# Altium schematic sheet CH32H417_USB3.SchDoc
size A4; SheetNumber: 11; SheetTotal: 11
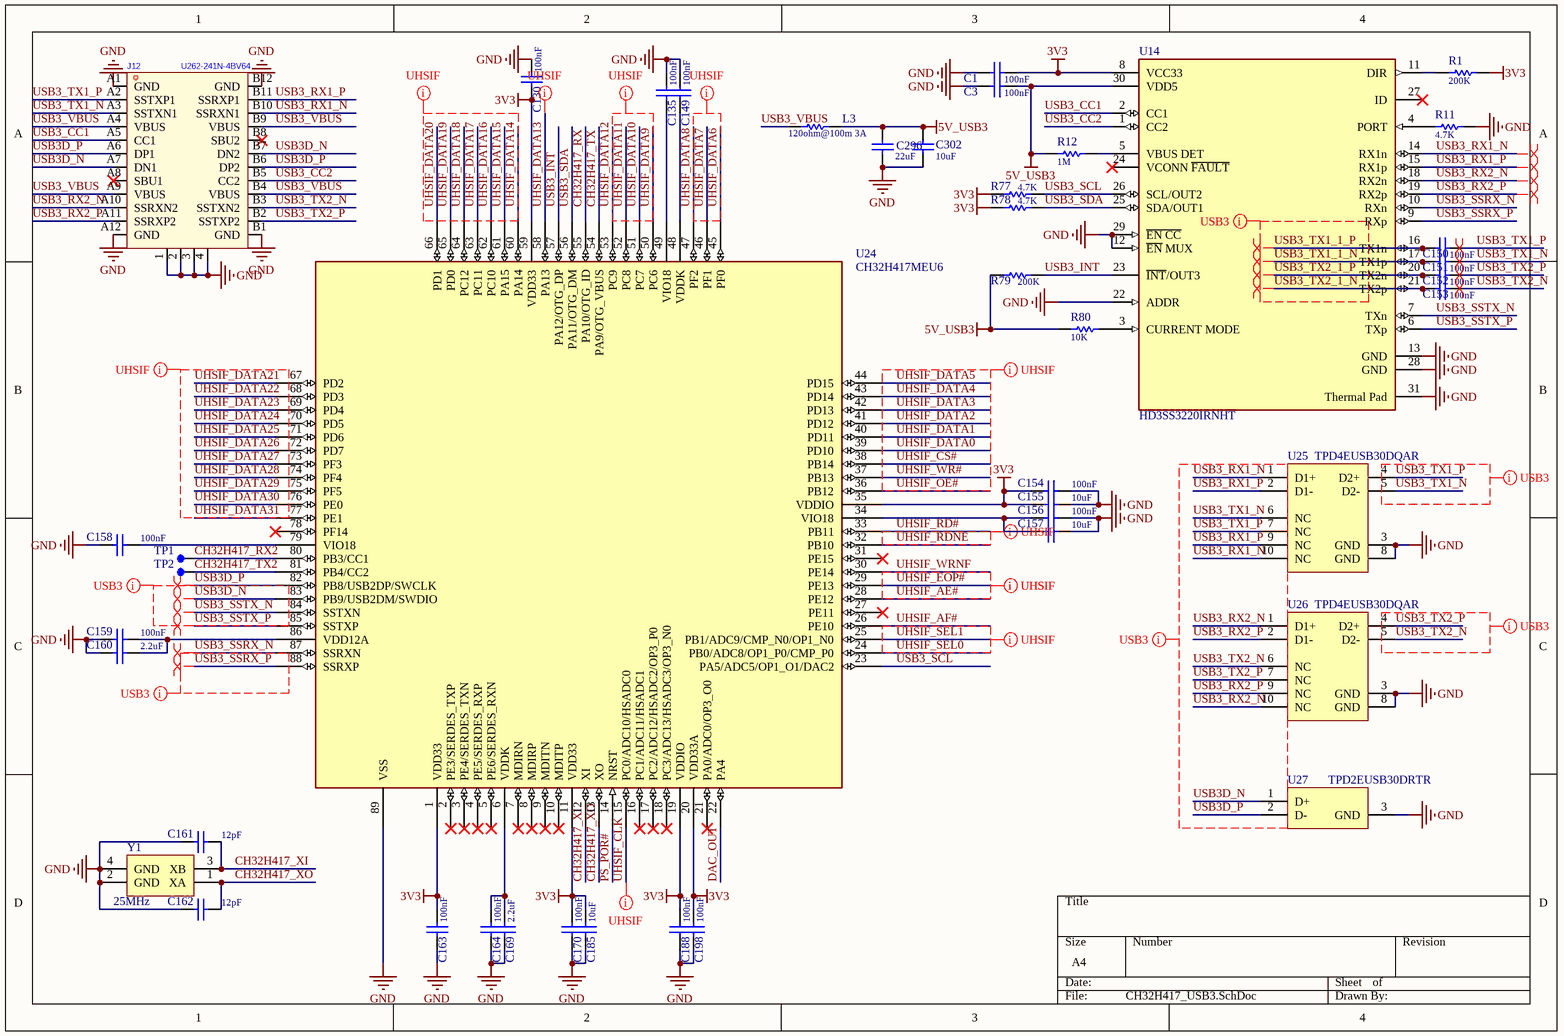
[diagram p0: CH32H417_USB3.SchDoc]

## Parts
C1  value 100nF  [C0402-L]  (hidden comment: Cap-S)
C3  value 100nF  [C0402-L]  (hidden comment: Cap-S)
C130  value 100nF  [C0402-L]  (hidden comment: Cap-S)
C135  value 100nF  [C0402-L]  (hidden comment: Cap-S)
C149  value 100nF  [C0402-L]  (hidden comment: Cap-S)
C150  value 100nF  [C0402-L]  (hidden comment: Cap-S)
C151  value 100nF  [C0402-L]  (hidden comment: Cap-S)
C152  value 100nF  [C0402-L]  (hidden comment: Cap-S)
C153  value 100nF  [C0402-L]  (hidden comment: Cap-S)
C154  value 100nF  [C0402-L]  (hidden comment: Cap-S)
C155  value 10uF  [C0603-M]  (hidden comment: Cap-S)
C156  value 100nF  [C0402-L]  (hidden comment: Cap-S)
C157  value 10uF  [C0603-M]  (hidden comment: Cap-S)
C158  value 100nF  [C0402-L]  (hidden comment: Cap-S)
C159  value 100nF  [C0402-L]  (hidden comment: Cap-S)
C160  value 2.2uF  [C0603-M]  (hidden comment: Cap-S)
C161  value 12pF  [C0402-L]  (hidden comment: Cap-S)
C162  value 12pF  [C0402-L]  (hidden comment: Cap-S)
C163  value 100nF  [C0402-L]  (hidden comment: Cap-S)
C164  value 100nF  [C0402-L]  (hidden comment: Cap-S)
C169  value 2.2uF  [C0603-M]  (hidden comment: Cap-S)
C170  value 100nF  [C0402-L]  (hidden comment: Cap-S)
C185  value 10uF  [C0603-M]  (hidden comment: Cap-S)
C188  value 100nF  [C0402-L]  (hidden comment: Cap-S)
C198  value 100nF  [C0402-L]  (hidden comment: Cap-S)
C296  value 22uF  [C0805-L]  (hidden comment: Cap-S)
C302  value 10uF  [C0603-L]  (hidden comment: Cap-S)
J12  U262-241N-4BV64  [USB-C-SMD_TYC-324G]
L3  value 120ohm@100m 3A  [R0805-L]  (hidden comment: R)
R1  value 200K  [R0402-L]  (hidden comment: R)
R11  value 4.7K  [R0402-L]  (hidden comment: R)
R12  value 1M  [R0402-L]  (hidden comment: R)
R77  value 4.7K  [R0402-L]  (hidden comment: R)
R78  value 4.7K  [R0402-L]  (hidden comment: R)
R79  value 200K  [R0402-L]  (hidden comment: R)
R80  value 10K  [R0402-L]  (hidden comment: R)
TP1  test point  [TP]  (value not drawn)
TP2  test point  [TP]  (value not drawn)
U14  HD3SS3220IRNHT  [FP-RNH0030A-IPC_C]
U24  CH32H417MEU6  [QFN-88_L10.0-W10.0-P0.40-BL-EP7.7]
U25  TPD4EUSB30DQAR  [DQA0010A_V]
U26  TPD4EUSB30DQAR  [DQA0010A_V]
U27  TPD2EUSB30DRTR  [DRT0003A]
Y1  25MHz  [CRYSTAL-SMD_4P-L2.0-W1.6-BL]

## Nets
3V3: C1.1 C130.1 C154.2 C155.2 C163.2 C170.2 C185.2 C188.2 C198.2 R1.1 R77.1 R78.1 U14.8(VCC33) U24.1(VDD33) U24.11(VDD33) U24.19(VDDIO) U24.20(VDD33A) U24.35(VDDIO) U24.59(VDD33)
5V_USB3: C3.1 C296.1 C302.1 L3.2 R12.2 R79.2 R80.1 U14.30(VDD5)
GND: C1.2 C3.2 C130.2 C135.2 C149.2 C154.1 C155.1 C156.1 C157.1 C158.2 C159.2 C160.2 C161.2 C162.2 C163.1 C164.1 C169.1 C170.1 C185.1 C188.1 C198.1 C296.2 C302.2 J12.1 J12.2 J12.3 J12.4 J12.A1(GND) J12.A12(GND) J12.B1(GND) J12.B12(GND) R11.2 U14.12(~{EN}_MUX) U14.13(GND) U14.22(ADDR) U14.28(GND) U14.29(~{EN_CC}) U14.31(Thermal_Pad) U24.89(VSS) U25.3(GND) U25.8(GND) U26.3(GND) U26.8(GND) U27.3(GND) Y1.2(GND) Y1.4(GND)
CH32H417_RX: U24.55(PA10/OTG_ID)
CH32H417_RX2: TP1.1 U24.80(PB3/CC1)
CH32H417_TX: U24.54(PA9/OTG_VBUS)
CH32H417_TX2: TP2.1 U24.81(PB4/CC2)
CH32H417_XI: C161.1 U24.12(XI) Y1.3(XB)
CH32H417_XO: C162.1 U24.13(XO) Y1.1(XA)
DAC_OUT: U24.22(PA4)
PS_POR#: U24.14(NRST)
UHSIF_AE#: U24.28(PE12)
UHSIF_AF#: U24.26(PE10)
UHSIF_CLK: U24.15(PC0/ADC10/HSADC0)
UHSIF_CS#: U24.38(PB14)
UHSIF_DATA0: U24.39(PD10)
UHSIF_DATA1: U24.40(PD11)
UHSIF_DATA2: U24.41(PD12)
UHSIF_DATA3: U24.42(PD13)
UHSIF_DATA4: U24.43(PD14)
UHSIF_DATA5: U24.44(PD15)
UHSIF_DATA6: U24.45(PF0)
UHSIF_DATA7: U24.46(PF1)
UHSIF_DATA8: U24.47(PF2)
UHSIF_DATA9: U24.50(PC6)
UHSIF_DATA10: U24.51(PC7)
UHSIF_DATA11: U24.52(PC8)
UHSIF_DATA12: U24.53(PC9)
UHSIF_DATA13: U24.58(PA13)
UHSIF_DATA14: U24.60(PA14)
UHSIF_DATA15: U24.61(PA15)
UHSIF_DATA16: U24.62(PC10)
UHSIF_DATA17: U24.63(PC11)
UHSIF_DATA18: U24.64(PC12)
UHSIF_DATA19: U24.65(PD0)
UHSIF_DATA20: U24.66(PD1)
UHSIF_DATA21: U24.67(PD2)
UHSIF_DATA22: U24.68(PD3)
UHSIF_DATA23: U24.69(PD4)
UHSIF_DATA24: U24.70(PD5)
UHSIF_DATA25: U24.71(PD6)
UHSIF_DATA26: U24.72(PD7)
UHSIF_DATA27: U24.73(PF3)
UHSIF_DATA28: U24.74(PF4)
UHSIF_DATA29: U24.75(PF5)
UHSIF_DATA30: U24.76(PE0)
UHSIF_DATA31: U24.77(PE1)
UHSIF_EOP#: U24.29(PE13)
UHSIF_OE#: U24.36(PB12)
UHSIF_RD#: U24.33(PB11)
UHSIF_RDNE: U24.32(PB10)
UHSIF_SEL0: U24.24(PB0/ADC8/OP1_P0/CMP_P0)
UHSIF_SEL1: U24.25(PB1/ADC9/CMP_N0/OP1_N0)
UHSIF_WR#: U24.37(PB13)
UHSIF_WRNF: U24.30(PE14)
USB3_CC1: J12.A5(CC1) U14.2(CC1)
USB3_CC2: J12.B5(CC2) U14.1(CC2)
USB3_INT: R79.1 U14.23(~{INT}/OUT3) U24.57(PA12/OTG_DP)
USB3_RX1_N: J12.B10(SSRXN1) U14.14(RX1n) U25.1(D1+) U25.10(NC)
USB3_RX1_P: J12.B11(SSRXP1) U14.15(RX1p) U25.2(D1-) U25.9(NC)
USB3_RX2_N: J12.A10(SSRXN2) U14.18(RX2n) U26.1(D1+) U26.10(NC)
USB3_RX2_P: J12.A11(SSRXP2) U14.19(RX2p) U26.2(D1-) U26.9(NC)
USB3_SCL: R77.2 U14.26(SCL/OUT2) U24.23(PA5/ADC5/OP1_O1/DAC2)
USB3_SDA: R78.2 U14.25(SDA/OUT1) U24.56(PA11/OTG_DM)
USB3_SSRX_N: U14.10(RXn) U24.87(SSRXN)
USB3_SSRX_P: U14.9(RXp) U24.88(SSRXP)
USB3_SSTX_N: U14.7(TXn) U24.84(SSTXN)
USB3_SSTX_P: U14.6(TXp) U24.85(SSTXP)
USB3_TX1_1_N: C151.2 U14.17(TX1p)
USB3_TX1_1_P: C150.2 U14.16(TX1n)
USB3_TX1_N: C151.1 J12.A3(SSTXN1) U25.5(D2-) U25.6(NC)
USB3_TX1_P: C150.1 J12.A2(SSTXP1) U25.4(D2+) U25.7(NC)
USB3_TX2_1_N: C153.2 U14.21(TX2p)
USB3_TX2_1_P: C152.2 U14.20(TX2n)
USB3_TX2_N: C153.1 J12.B3(SSTXN2) U26.5(D2-) U26.6(NC)
USB3_TX2_P: C152.1 J12.B2(SSTXP2) U26.4(D2+) U26.7(NC)
USB3_VBUS: J12.A4(VBUS) J12.A9(VBUS) J12.B4(VBUS) J12.B9(VBUS) L3.1
USB3D_N: J12.A7(DN1) J12.B7(DN2) U24.83(PB9/USB2DM/SWDIO) U27.1(D+)
USB3D_P: J12.A6(DP1) J12.B6(DP2) U24.82(PB8/USB2DP/SWCLK) U27.2(D-)
NetC135_1: C135.1 U24.49(VIO18)
NetC149_1: C149.1 U24.48(VDDK)
NetC156_2: C156.2 C157.2 U24.34(VIO18)
NetC158_1: C158.1 U24.79(VIO18)
NetC159_1: C159.1 C160.1 U24.86(VDD12A)
NetC164_2: C164.2 C169.2 U24.6(VDDK)
NetR1_2: R1.2 U14.11(DIR)
NetR11_1: R11.1 U14.4(PORT)
NetR12_1: R12.1 U14.5(VBUS_DET)
NetR80_2: R80.2 U14.3(CURRENT_MODE)

Not connected (* = marked no-connect by the designer): J12 A8(SBU1)* B8(SBU2)*; U14 24(VCONN_~{FAULT})* 27(ID)*; U24 2(PE3/SERDES_TXP)* 3(PE4/SERDES_TXN)* 4(PE5/SERDES_RXP)* 5(PE6/SERDES_RXN)* 7(MDIRN)* 8(MDIRP)* 9(MDITN)* 10(MDITP)* 16(PC1/ADC11/HSADC1)* 17(PC2/ADC12/HSADC2/OP3_P0)* 18(PC3/ADC13/HSADC3/OP3_N0)* 21(PA0/ADC0/OP3_O0)* 27(PE11)* 31(PE15)* 78(PF14)*

## Layout directives
differential pair: USB3_RX1_N, USB3_RX1_P, USB3_RX2_N, USB3_RX2_P, USB3_SSRX_N, USB3_SSRX_P, USB3_SSTX_N, USB3_SSTX_P, USB3_TX1_1_N, USB3_TX1_1_P, USB3_TX1_N, USB3_TX1_P, USB3_TX2_1_N, USB3_TX2_1_P, USB3_TX2_N, USB3_TX2_P, USB3D_N, USB3D_P
net class UHSIF: UHSIF_CLK, UHSIF_CS#, UHSIF_DATA0, UHSIF_DATA1, UHSIF_DATA2, UHSIF_DATA3, UHSIF_DATA4, UHSIF_DATA5, UHSIF_DATA6, UHSIF_DATA7, UHSIF_DATA8, UHSIF_DATA9, UHSIF_DATA10, UHSIF_DATA11, UHSIF_DATA12, UHSIF_DATA13, UHSIF_DATA14, UHSIF_DATA15, UHSIF_DATA16, UHSIF_DATA17, UHSIF_DATA18, UHSIF_DATA19, UHSIF_DATA20, UHSIF_DATA21, UHSIF_DATA22, UHSIF_DATA23, UHSIF_DATA24, UHSIF_DATA25, UHSIF_DATA26, UHSIF_DATA27, UHSIF_DATA28, UHSIF_DATA29, UHSIF_DATA30, UHSIF_DATA31, UHSIF_EOP#, UHSIF_OE#, UHSIF_RD#, UHSIF_SEL1, UHSIF_WR#
net class USB3: USB3_RX1_N, USB3_RX1_P, USB3_RX2_N, USB3_RX2_P, USB3_SSRX_N, USB3_SSRX_P, USB3_SSTX_N, USB3_SSTX_P, USB3_TX1_1_N, USB3_TX1_1_P, USB3_TX1_N, USB3_TX1_P, USB3_TX2_1_N, USB3_TX2_1_P, USB3_TX2_N, USB3_TX2_P, USB3D_N, USB3D_P

## Library data of the parts
C1 C3 C130 C135 C149-C164 C169 C170 C185 C188 C198 C296 C302 = Cap-S: 贴片瓷片电容
J12 = TYPE-C-USB3: USB3.0的typec接口; Manufacturer: XKB Connection(中国星坤); Add into BOM: yes; Connector Type: Type-C; Gender: 母; Number of Contacts: 24P; Number of Ports: 1; Current Rating - Power (Max): 5A; Soldering Temperature(Max): 260℃; Symbol: U262-241N-4BV64; Device: U262-241N-4BV64; LCSC Part Name: Type-C 母; Supplier Part: C388660; Manufacturer Part: U262-241N-4BV64; Supplier Footprint: SMD; JLCPCB Part Class: Extended Part; Datasheet: https://atta.szlcsc.com/upload/public/pdf/source/20211015/8B22A47B12BDC5CD319611427B3C1C1B.pdf; Supplier: LCSC; Convert to PCB: yes; Standard: -; Mounting Style: -; Contact Material: 高导铜; Contact Plating: 金; Operating Temperature Range: -40℃~+85℃
L3 R1 R11 R12 R77-R80 = Res: 贴片电阻
TP1 TP2 = TP
U14 = CMP-04877-000019-1: USB TYPE-C DRP PORT CONTROLLER W; Max Supply Voltage: 5.5V; Min Supply Voltage: 3V; Number of Ports: 1; Data Rate: 10Gbps; USB Standard: USB 3.1; Mount: Surface Mount; Max Operating Temperature: 70°C; Lead Free: Lead Free; RoHS Compliant: Yes; Packaging: Tape and Reel; Number of Pins: 30; Min Operating Temperature: 0°C; REACH SVHC: No SVHC
U24 = CH32H417MEU6: RISC-V FPU HD-MCU, 384MHz, USB3.0 & PD, 100M Ethernet, DVP, QSPI, OPA, ADC, DAC
U25 U26 = CMP-0326-00027-3: ESD Solution for Super-Speed (6 GBPS) USB 3.0 Interface, 4 Channels, -40 to +85 degC, 10-pin SON (DQA), Green (RoHS & no Sb/Br); Manufacturer: Texas Instruments; Differential Capacitance(pF): 0.05; Serial ATA / eSATA: TRUE; IO Capacitance(Typ)(pF): 0.8; IO Leakage Current(nA): 10; IEC 61000-4-2 Air-Gap(+/- kV): 8; ComponentLink3Description: URL Link1; PartNumber: TPD4EUSB30DQAR; DatasheetVersion: SLVSAC2C; ComponentLink2URL: http://www.ti.com/general/docs/lit/getliterature.tsp?genericPartNumber=TPD4EUSB30&fileType=pdf; USB Super Speed: TRUE; Eco-Plan: Green (RoHS & no Sb/Br); Mounting Technology: Surface Mount; 1394 / Firewire: TRUE; PackageVersion: revB, Sep-2009; SubFamily: ESD Solution; USB Full Speed: TRUE; USB High Speed: TRUE; ComponentLink2Description: Datasheet; ComponentLink1URL: http://www.ti.com/; IEC 61000-4-2 Contact(+/- kV): 8; Breakdown Voltage(Min)(V): 8; PackageReference: DQA0010A; ComponentLink1Description: Manufacturer URL; PackageDescription: 10-Pin Plastic Small Outline No-Lead, 1 x 2.5 x 0.55 mm Body, 0.5 mm Pitch; ComponentLink3URL: SamplesURL:http://www.ti.com/product/tpd4eusb30#samples; HDMI: TRUE
U27 = CMP-0326-00046-3: ESD Solution for Super-Speed (6 Gbps) USB 3.0 Interface, 2 Channels, -40 to +85 degC, 3-pin SOT (DRT), Green (Rohs & No Sb/Br); Manufacturer: Texas Instruments; Differential Capacitance(pF): 0.01; Breakdown Voltage(Min)(V): 9; HDMI: TRUE; IEC 61000-4-2 Air-Gap(+/- kV): 8; IO Leakage Current(nA): 10; IO Capacitance(Typ)(pF): 0.7; Mounting Technology: Surface Mount; PackageDescription: 3-Flat Lead Plastic Small Outline, 1 x 1 mm (inc leads), 0.35 mm Pitch; IEC 61000-4-2 Contact(+/- kV): 8; USB Super Speed: TRUE; Eco-Plan: Green (RoHS & no Sb/Br); USB High Speed: TRUE; PackageReference: DRT0003A; SubFamily: ESD Solution; USB Full Speed: TRUE; ComponentLink1Description: Datasheet; ComponentLink2URL: SamplesURL:http://www.ti.com/product/tpd2eusb30#samples; PackageVersion: revD, Jun-2008; ComponentLink2Description: URL Link1; 1394 / Firewire: TRUE; PartNumber: TPD2EUSB30DRTR; ComponentLink1URL: http://www.ti.com/general/docs/lit/getliterature.tsp?genericPartNumber=TPD2EUSB30&fileType=pdf; DatasheetVersion: SLVSAC2C; Serial ATA / eSATA: TRUE
Y1 = XTAL-PASS